# Altium schematic sheet Comms_CAN2.SchDoc: Interface - CAN FD 2 Transceiver TCAN3414
size A3; ApprovedBy: Weymen Koo; CheckedBy: -; DrawnBy: Weymen Koo; DocumentNumber: UBCAD-FCSOM-SCH; Revision: A; SheetNumber: 14; SheetTotal: 18; ProjectTitle: Flight Controller SoM; Status: PRELIMINARY; ReleaseDate: 2026-11-14
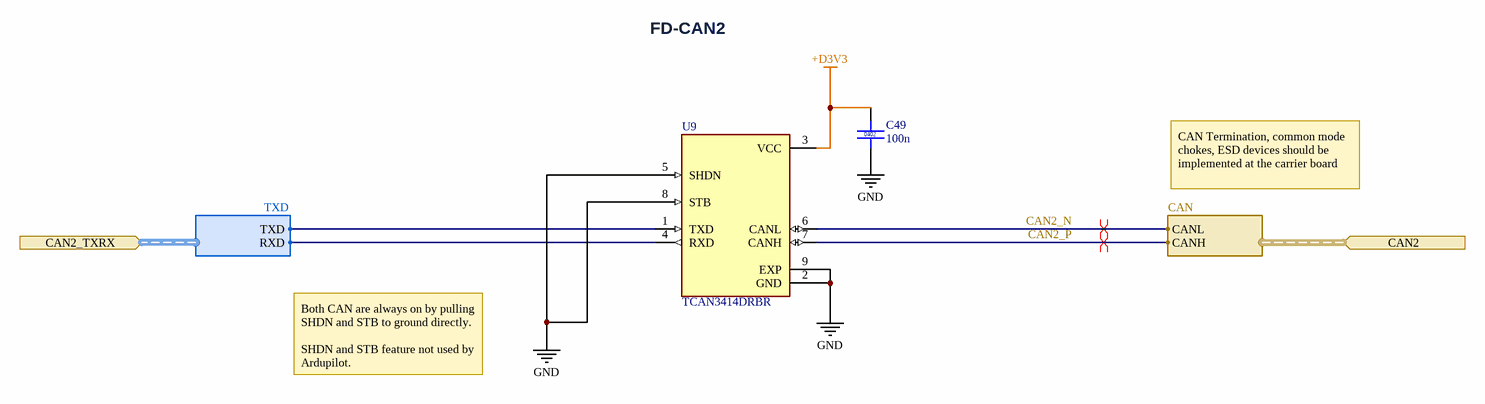
[diagram p0: Comms_CAN2.SchDoc]

## Parts
C49  100n  [CAPC1005X05N]
U9  TCAN3414DRBR  [XCVR_TCAN3414DRBR]

## Ports
CAN2 (in, harness CAN, see 1[6A], 18[7C]), CAN2_TXRX (in, harness TXD, see 1[5A], 4[5D])

## Harnesses
CAN: CANL, CANH
TXD: TXD, RXD

## Nets
+D3V3: C49.1 U9.3(VCC)
GND: C49.2 U9.2(GND) U9.5(SHDN) U9.8(STB) U9.9(EXP)
CAN2_N: U9.6(CANL) ; port CAN2.CANL
CAN2_P: U9.7(CANH) ; port CAN2.CANH
NetU9_1: U9.1(TXD) ; port CAN2_TXRX.TXD
NetU9_4: U9.4(RXD) ; port CAN2_TXRX.RXD

## Layout directives
differential pair: CAN2_N, CAN2_P

## Notes on the sheet
- FD-CAN2
- CAN Termination, common mode chokes, ESD devices should be implemented at the carrier board
- Both CAN are always on by pulling SHDN and STB to ground directly.
  SHDN and STB feature not used by Ardupilot.
- PROJECT
- KEY
- POWER
- 5 V class
- 3.3 V class
- Core / SMPS
- GND
- SHEET TITLE
- SIGNALS
- NOTES
- SPI
- Analog
- Design
- I2C
- PWM/Timer
- Layout
- UART/RC
- GPIO/Ctrl
- Assembly
- CAN
- Unused pin
- Firmware
- USB/SD/Clk
- Critical
- DRAWN
- DOCUMENT NO.
- CHECKED
- REV
- STATUS
- APPROVED
- DATE
- FILE
- SIZE
- A3
- SHEET
- of

## Library data of the parts
C49 = CMP-002-000094-5: CAP 100n 16V X7R 10% 0402; Manufacturer: Samsung; Manufacturer Part Number: CL05B104KO5NNNC; Value: 100n; Tolerance: 10%; Package: 0402; Voltage: 16V; Dielectric: X7R; LCSC Part #: C1525
U9 = CMP-322-000000-2: 1/1 Transceiver Half CANbus 8-SON (3x3); MF: Texas Instruments; Check_prices: https://www.snapeda.com/parts/TCAN3414DRBR/Texas+Instruments/view-part/?ref=eda; SnapEDA_Link: https://www.snapeda.com/parts/TCAN3414DRBR/Texas+Instruments/view-part/?ref=snap; MP: TCAN3414DRBR; Design Item ID: TCAN3414DRBR; Component Type: Standard; Pin Count: 9; Source: TCAN3414DRBR.SchLib; Value: *; Package: None